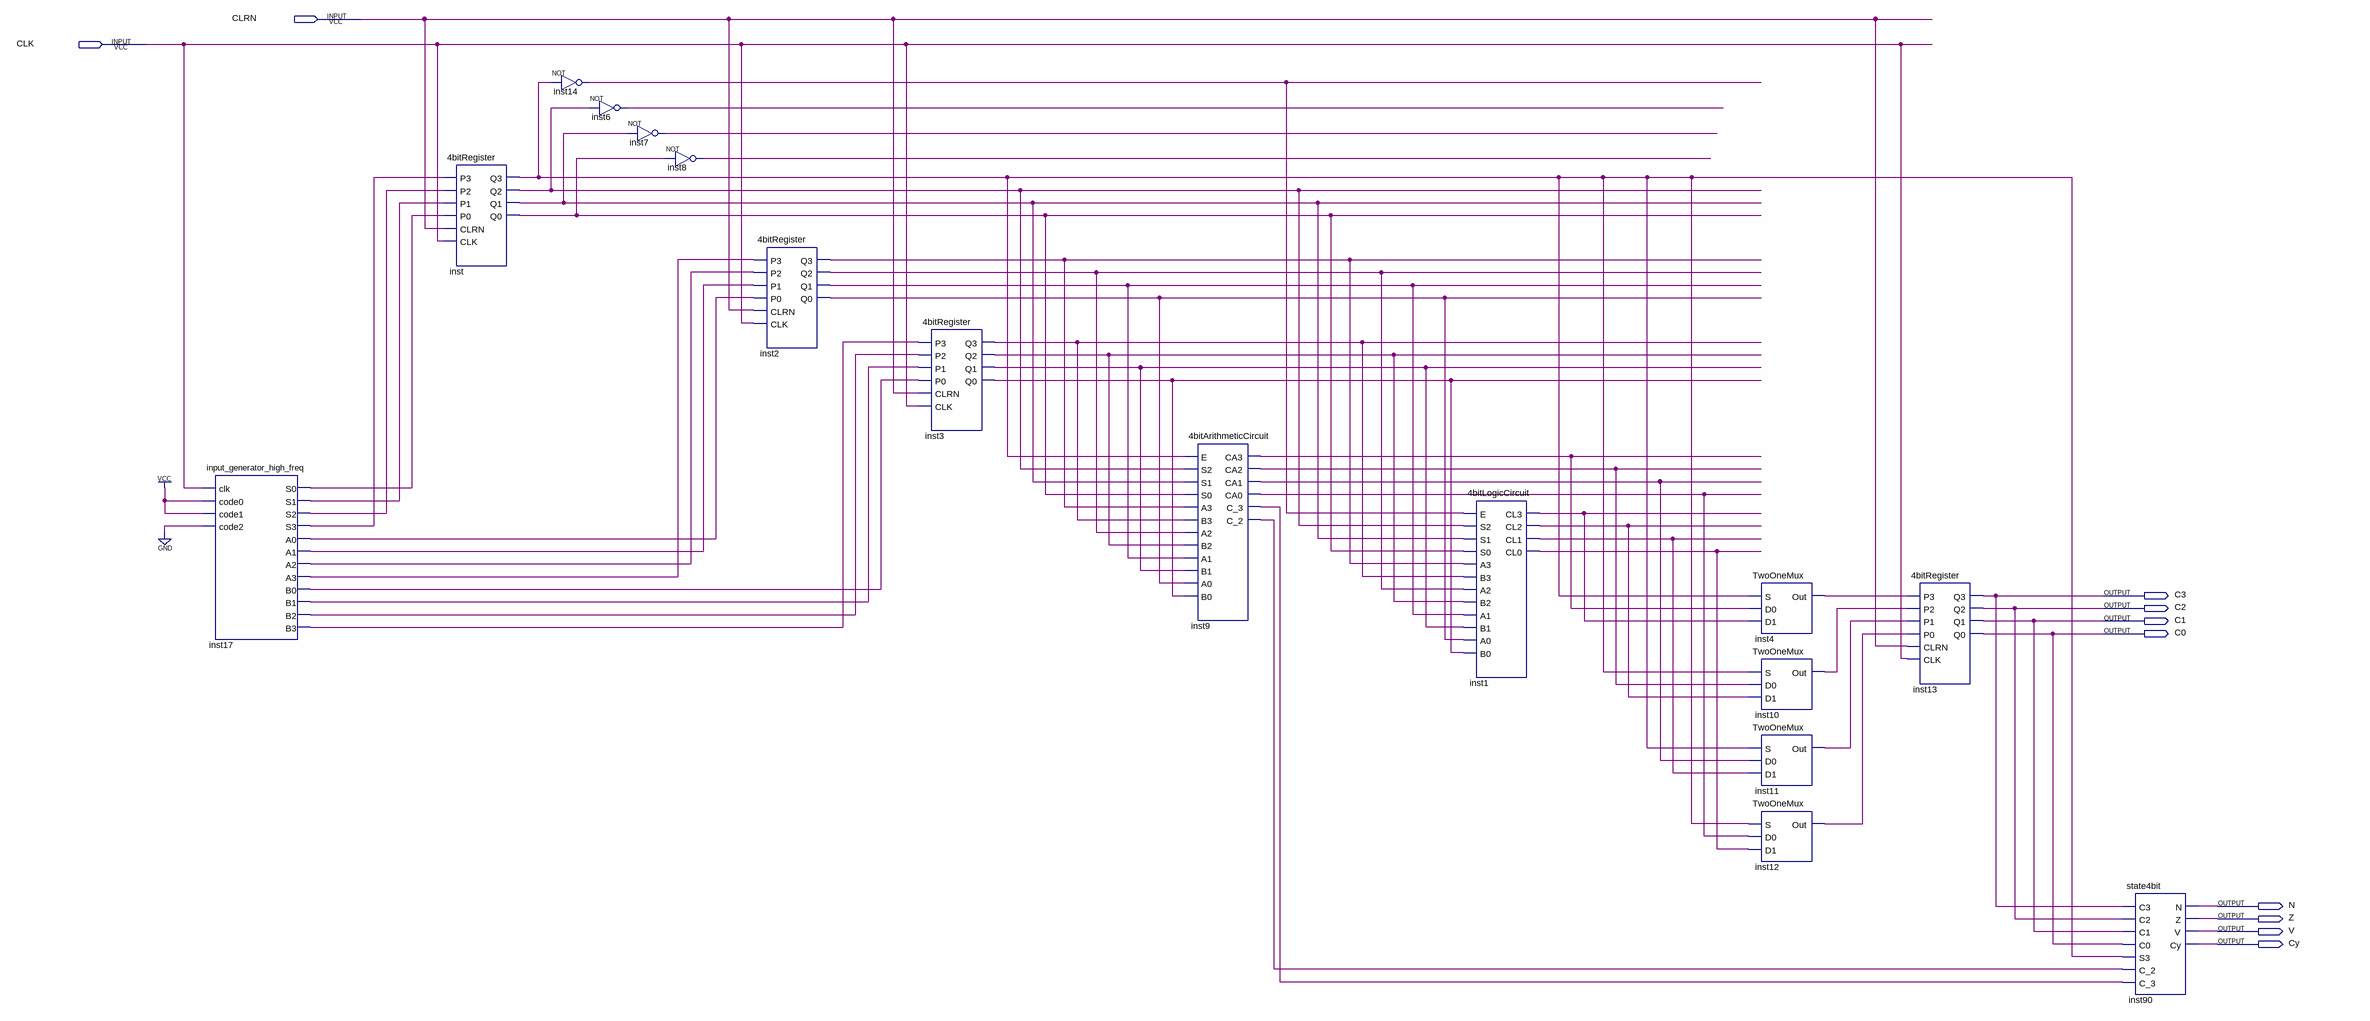
[diagram p0: schematic sheet]
// Quartus schematic Lab3_top.bdf as structural Verilog: 16 symbols, 10 pins
module Lab3_top (
  input  CLRN,
  input  CLK,
  output C3,
  output C2,
  output C1,
  output C0,
  output N,
  output Z,
  output V,
  output Cy
);

  wire inst1_cl0, inst1_cl1, inst1_cl2, inst1_cl3, inst2_q0, inst2_q1, inst2_q2, inst2_q3, inst3_q0,
       inst3_q1, inst3_q2, inst3_q3, inst4_out, inst6_out, inst7_out, inst8_out, inst9_c_2, inst9_c_3,
       inst9_ca0, inst9_ca1, inst9_ca2, inst9_ca3, inst10_out, inst11_out, inst12_out, inst14_out, inst17_a0,
       inst17_a1, inst17_a2, inst17_a3, inst17_b0, inst17_b1, inst17_b2, inst17_b3, inst17_s0, inst17_s1,
       inst17_s2, inst17_s3, inst_q0, inst_q1, inst_q2, inst_q3;

  input_generator_high_freq inst17 (
    .clk(CLK), .code0(1'b1), .code1(1'b1), .code2(1'b0), .S0(inst17_s0), .S1(inst17_s1), .S2(inst17_s2),
    .S3(inst17_s3), .A0(inst17_a0), .A1(inst17_a1), .A2(inst17_a2), .A3(inst17_a3), .B0(inst17_b0),
    .B1(inst17_b1), .B2(inst17_b2), .B3(inst17_b3));
  \4bitRegister  inst (
    .P3(inst17_s3), .P2(inst17_s2), .P1(inst17_s1), .P0(inst17_s0), .CLRN(CLRN), .CLK(CLK), .Q3(inst_q3),
    .Q2(inst_q2), .Q1(inst_q1), .Q0(inst_q0));
  not inst14 (inst14_out, inst_q3);
  not inst6 (inst6_out, inst_q2);
  not inst7 (inst7_out, inst_q1);
  not inst8 (inst8_out, inst_q0);
  \4bitRegister  inst2 (
    .P3(inst17_a3), .P2(inst17_a2), .P1(inst17_a1), .P0(inst17_a0), .CLRN(CLRN), .CLK(CLK), .Q3(inst2_q3),
    .Q2(inst2_q2), .Q1(inst2_q1), .Q0(inst2_q0));
  \4bitRegister  inst3 (
    .P3(inst17_b3), .P2(inst17_b2), .P1(inst17_b1), .P0(inst17_b0), .CLRN(CLRN), .CLK(CLK), .Q3(inst3_q3),
    .Q2(inst3_q2), .Q1(inst3_q1), .Q0(inst3_q0));
  \4bitArithmeticCircuit  inst9 (
    .E(inst_q3), .S2(inst_q2), .S1(inst_q1), .S0(inst_q0), .A3(inst2_q3), .B3(inst3_q3), .A2(inst2_q2),
    .B2(inst3_q2), .A1(inst2_q1), .B1(inst3_q1), .A0(inst2_q0), .B0(inst3_q0), .CA3(inst9_ca3),
    .CA2(inst9_ca2), .CA1(inst9_ca1), .CA0(inst9_ca0), .C_3(inst9_c_3), .C_2(inst9_c_2));
  \4bitLogicCircuit  inst1 (
    .E(inst14_out), .S2(inst_q2), .S1(inst_q1), .S0(inst_q0), .A3(inst2_q3), .B3(inst3_q3), .A2(inst2_q2),
    .B2(inst3_q2), .A1(inst2_q1), .B1(inst3_q1), .A0(inst2_q0), .B0(inst3_q0), .CL3(inst1_cl3),
    .CL2(inst1_cl2), .CL1(inst1_cl1), .CL0(inst1_cl0));
  TwoOneMux inst4 (.S(inst_q3), .D0(inst9_ca3), .D1(inst1_cl3), .Out(inst4_out));
  TwoOneMux inst10 (.S(inst_q3), .D0(inst9_ca2), .D1(inst1_cl2), .Out(inst10_out));
  TwoOneMux inst11 (.S(inst_q3), .D0(inst9_ca1), .D1(inst1_cl1), .Out(inst11_out));
  TwoOneMux inst12 (.S(inst_q3), .D0(inst9_ca0), .D1(inst1_cl0), .Out(inst12_out));
  \4bitRegister  inst13 (
    .P3(inst4_out), .P2(inst10_out), .P1(inst11_out), .P0(inst12_out), .CLRN(CLRN), .CLK(CLK), .Q3(C3),
    .Q2(C2), .Q1(C1), .Q0(C0));
  state4bit inst90 (
    .C3(C3), .C2(C2), .C1(C1), .C0(C0), .S3(inst_q3), .C_2(inst9_c_2), .C_3(inst9_c_3), .N(N), .Z(Z), .V(V),
    .Cy(Cy));
endmodule
